# Altium schematic sheet Sheet_con_WiFi_2026-02-11.schdoc
size 262 x 181 mm
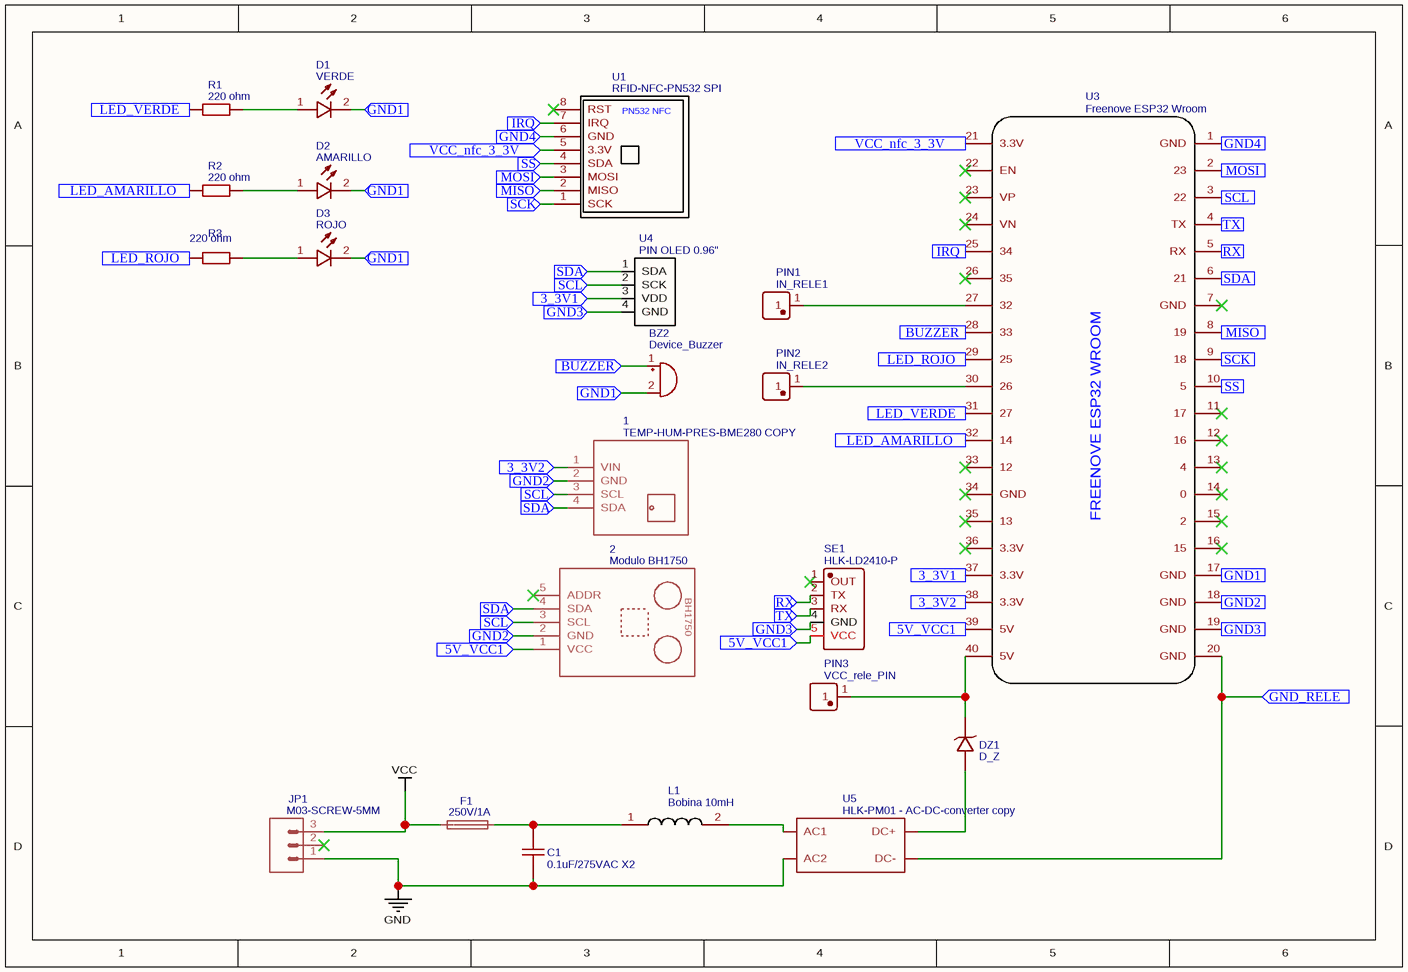
[diagram p0: Sheet_con_WiFi_2026-02-11.schdoc]

## Parts
1  TEMP-HUM-PRES-BME280 COPY  [TEMP-HUM-PRES-BME280]
2  Modulo BH1750  [BH1750]
BZ2  Device_Buzzer  [BUZZER_BEEPER:BUZZER_12X9.5RM7.6]
C1  0.1uF/275VAC X2  [CAP-TH_L18.0-W6.0-P15.00-D0.8]
D1  VERDE  [LED-TH_LED-DP2-2LED-AMCC]
D2  AMARILLO  [LED-TH_LED-DP2-2LED-AMCC]
D3  ROJO  [LED-TH_LED-DP2-2LED-AMCC]
DZ1  D_Z  [DIODO]
F1  250V/1A  [FUSE-HOLDER-WITH-COVER-FOR-5X20MM-FUSE_FOOTPRINT]
JP1  M03-SCREW-5MM  [SCREWTERMINAL-5MM-3]
L1  Bobina 10mH  [BOBINA]
PIN1  IN_RELE1  [TH_POGOPIN]
PIN2  IN_RELE2  [TH_POGOPIN]
PIN3  VCC_rele_PIN  [TH_POGOPIN]
R1  220 ohm  [AXIAL-0.6]
R2  220 ohm  [AXIAL-0.6]
R3  220 ohm  [AXIAL-0.6]
SE1  HLK-LD2410-P  [SENSOR-TH_HLK-LD2410-P]
U1  RFID-NFC-PN532 SPI  [RFID-NFC-V3 PN532 SPI 1SCREW]
U3  Freenove ESP32 Wroom  [FREENOVE ESP32 WROOM]
U4  PIN OLED 0.96"  [PIN OLED 0.96"]
U5  HLK-PM01 - AC-DC-converter copy  [HLK-PM01]

## Ports
3_3V1 (in), 3_3V2 (in), 5V_VCC1 (in), BUZZER (in), GND1 (in), GND2 (in), GND3 (in), GND4 (in), GND_RELE (in), IRQ (in), LED_AMARILLO (in), LED_ROJO (in), LED_VERDE (in), MISO (in), MOSI (in), RX (in), SCK (in), SCL (in), SDA (in), SS (in), TX (in), VCC_nfc_3_3V (in)

## Nets
GND: C1.1 JP1.1 U5.2(AC2)
VCC: F1.2 JP1.3
3_3V1: U3.37(3.3V) U4.3(VDD) ; port 3_3V1
3_3V2: 1.1(VIN) U3.38(3.3V) ; port 3_3V2
5V_VCC1: 2.1(VCC) SE1.5(VCC) U3.39(5V) ; port 5V_VCC1
BUZZER: BZ2.1(+) U3.28(33) ; port BUZZER
GND1: BZ2.2(-) D1.2(K) D2.2(K) D3.2(K) U3.17(GND) ; port GND1
GND2: 1.2(GND) 2.2(GND) U3.18(GND) ; port GND2
GND3: SE1.4(GND) U3.19(GND) U4.4(GND) ; port GND3
GND4: U1.6(GND) U3.1(GND) ; port GND4
GND_RELE: U3.20(GND) U5.3(DC-) ; port GND_RELE
IRQ: U1.7(IRQ) U3.25(34) ; port IRQ
LED_AMARILLO: R2.1 U3.32(14) ; port LED_AMARILLO
LED_ROJO: R3.1 U3.29(25) ; port LED_ROJO
LED_VERDE: R1.1 U3.31(27) ; port LED_VERDE
MISO: U1.2(MISO) U3.8(19) ; port MISO
MOSI: U1.3(MOSI) U3.2(23) ; port MOSI
RX: SE1.2(TX) U3.5(RX) ; port RX
SCK: U1.1(SCK) U3.9(18) ; port SCK
SCL: 1.3(SCL) 2.3(SCL) U3.3(22) U4.2(SCK) ; port SCL
SDA: 1.4(SDA) 2.4(SDA) U3.6(21) U4.1(SDA) ; port SDA
SS: U1.4(SDA) U3.10(5) ; port SS
TX: SE1.3(RX) U3.4(TX) ; port TX
VCC_nfc_3_3V: U1.5(3.3V) U3.21(3.3V) ; port VCC_nfc_3_3V
NetC1_2: C1.2 F1.1 L1.1
NetD1_1: D1.1(A) R1.2
NetD2_1: D2.1(A) R2.2
NetD3_1: D3.1(A) R3.2
NetDZ1_1: DZ1.1(A) U5.4(DC+)
NetDZ1_2: DZ1.2(K) PIN3.1 U3.40(5V)
NetL1_2: L1.2 U5.1(AC1)
NetPIN1_1: PIN1.1 U3.27(32)
NetPIN2_1: PIN2.1 U3.30(26)

Not connected (* = marked no-connect by the designer): 2 5(ADDR)*; JP1 2*; SE1 1(OUT)*; U1 8(RST)*; U3 7(GND)* 11(17)* 12(16)* 13(4)* 14(0)* 15(2)* 16(15)* 22(EN)* 23(VP)* 24(VN)* 26(35)* 33(12)* 34(GND)* 35(13)* 36(3.3V)*

## Notes on the sheet
- (in symbol Freenove ESP32 Wroom) FREENOVE ESP32 WROOM
- (in symbol Modulo BH1750) BH1750
- (in symbol RFID-NFC-PN532 SPI) PN532 NFC

## Library data of the parts
1 = TEMP-HUM-PRES-BME280 COPY: Contributor: Lorenz Hohn; spicePre: ?; spiceSymbolName: TEMP-HUM-PRES-BME280 COPY
2 = Modulo BH1750: Contributor: Aucamana; spicePre: ?; spiceSymbolName: Modulo BH1750
BZ2 = Device_Buzzer: Add into BOM: yes; Contributor: t.teenoom; Symbol: Device_Buzzer; Device: Device_Buzzer; User doc link: ~; Convert to PCB: yes; Origin Footprint: Buzzer_Beeper:Buzzer_12x9.5RM7.6; spicePre: B; spiceSymbolName: Device_Buzzer
C1 = 0.1uF/275VAC X2: Manufacturer: null; Manufacturer Part: 100nF/275V; Contributor: ssouravct; Supplier: LCSC; Supplier Part: C9900015374; JLCPCB Part Class: Extended Part; spicePre: U; spiceSymbolName: 100NF/275V
D1 = VERDE: Manufacturer: VccLite; Manufacturer Part: 5600; Contributor: rivithpc; Supplier: Digi-Key; Supplier Part: L20325-ND; link: https://vcclite.com/product/5602f5-5v/; spicePre: D; spiceSymbolName: RAJENDRA_LED
D2 = AMARILLO: Manufacturer: VccLite; Manufacturer Part: 5600; Contributor: rivithpc; Supplier: Digi-Key; Supplier Part: L20325-ND; link: https://vcclite.com/product/5602f5-5v/; spicePre: D; spiceSymbolName: RAJENDRA_LED
D3 = ROJO: Manufacturer: VccLite; Manufacturer Part: 5600; Contributor: rivithpc; Supplier: Digi-Key; Supplier Part: L20325-ND; link: https://vcclite.com/product/5602f5-5v/; spicePre: D; spiceSymbolName: RAJENDRA_LED
DZ1 = D_Z: Contributor: mak_paint; spicePre: D; spiceSymbolName: D_Z
F1 = 250V/1A: Contributor: 21102406; spicePre: F; spiceSymbolName: FUSE HOLDER WITH COVER FOR 5X20MM FUSE
JP1 = M03-SCREW-5MM: Contributor: SiddhantGhosh; spicePre: J; spiceSymbolName: M03-SCREW-5MM
L1 = Bobina 10mH: Contributor: harastasansergiu; spicePre: L; spiceSymbolName: Bobina
PIN1 = IN_RELE1: Manufacturer: null; Manufacturer Part: pogopin 弹簧顶针(9.0H-2.0T直通加粗); Contributor: LCSC; Supplier: LCSC; Supplier Part: C9900001338; JLCPCB Part Class: Extended Part; spicePre: U; spiceSymbolName: POGOPIN 弹簧顶针(9.0H-2.0T直通加粗)
PIN2 = IN_RELE2: Manufacturer: null; Manufacturer Part: pogopin 弹簧顶针(9.0H-2.0T直通加粗); Contributor: LCSC; Supplier: LCSC; Supplier Part: C9900001338; JLCPCB Part Class: Extended Part; spicePre: U; spiceSymbolName: POGOPIN 弹簧顶针(9.0H-2.0T直通加粗)
PIN3 = VCC_rele_PIN: Manufacturer: null; Manufacturer Part: pogopin 弹簧顶针(9.0H-2.0T直通加粗); Contributor: LCSC; Supplier: LCSC; Supplier Part: C9900001338; JLCPCB Part Class: Extended Part; spicePre: U; spiceSymbolName: POGOPIN 弹簧顶针(9.0H-2.0T直通加粗)
R1-R3 = 220 ohm: Manufacturer: ResistorToday; Manufacturer Part: EWWR0001J20R0T9; nameAlias: Value; Contributor: LCSC; Supplier: LCSC; Supplier Part: C348838; spicePre: R; spiceSymbolName: TH RES 5.5MM
SE1 = HLK-LD2410-P: Manufacturer: HI-LINK(海凌科); Contributor: lcsc; Supplier: LCSC; Supplier Part: C5183133; Manufacturer Part: HLK-LD2410-P; JLCPCB Part Class: Extended Part; spicePre: S; spiceSymbolName: HLK-LD2410-P
U1 = RFID-NFC-PN532 SPI: Contributor: varun varghese; spicePre: U; spiceSymbolName: RFID-NFC-PN532 SPI
U3 = Freenove ESP32 Wroom: Contributor: konstantinovbogdan9; Supplier: Freenove; spicePre: U; spiceSymbolName: Freenove ESP32 Wroom
U4 = PIN OLED 0.96": Contributor: karelintang77; Supplier: LCSC; spicePre: U; spiceSymbolName: PIN OLED 0.96"
U5 = HLK-PM01 - AC-DC-converter copy: sourceId: u1BzxTRca; timeStamp: 1473764318; spicePre: U; spiceSymbolName: HLK-PM01 - AC-DC-converter copy